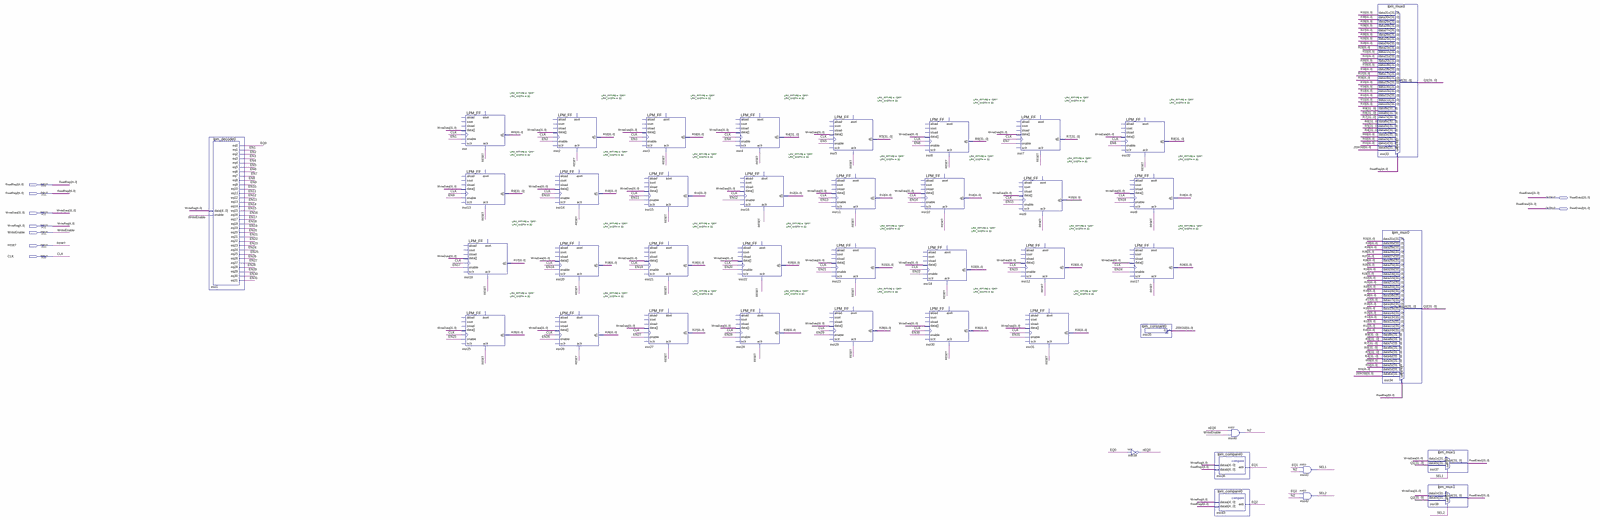
[diagram p0: schematic sheet, whole]
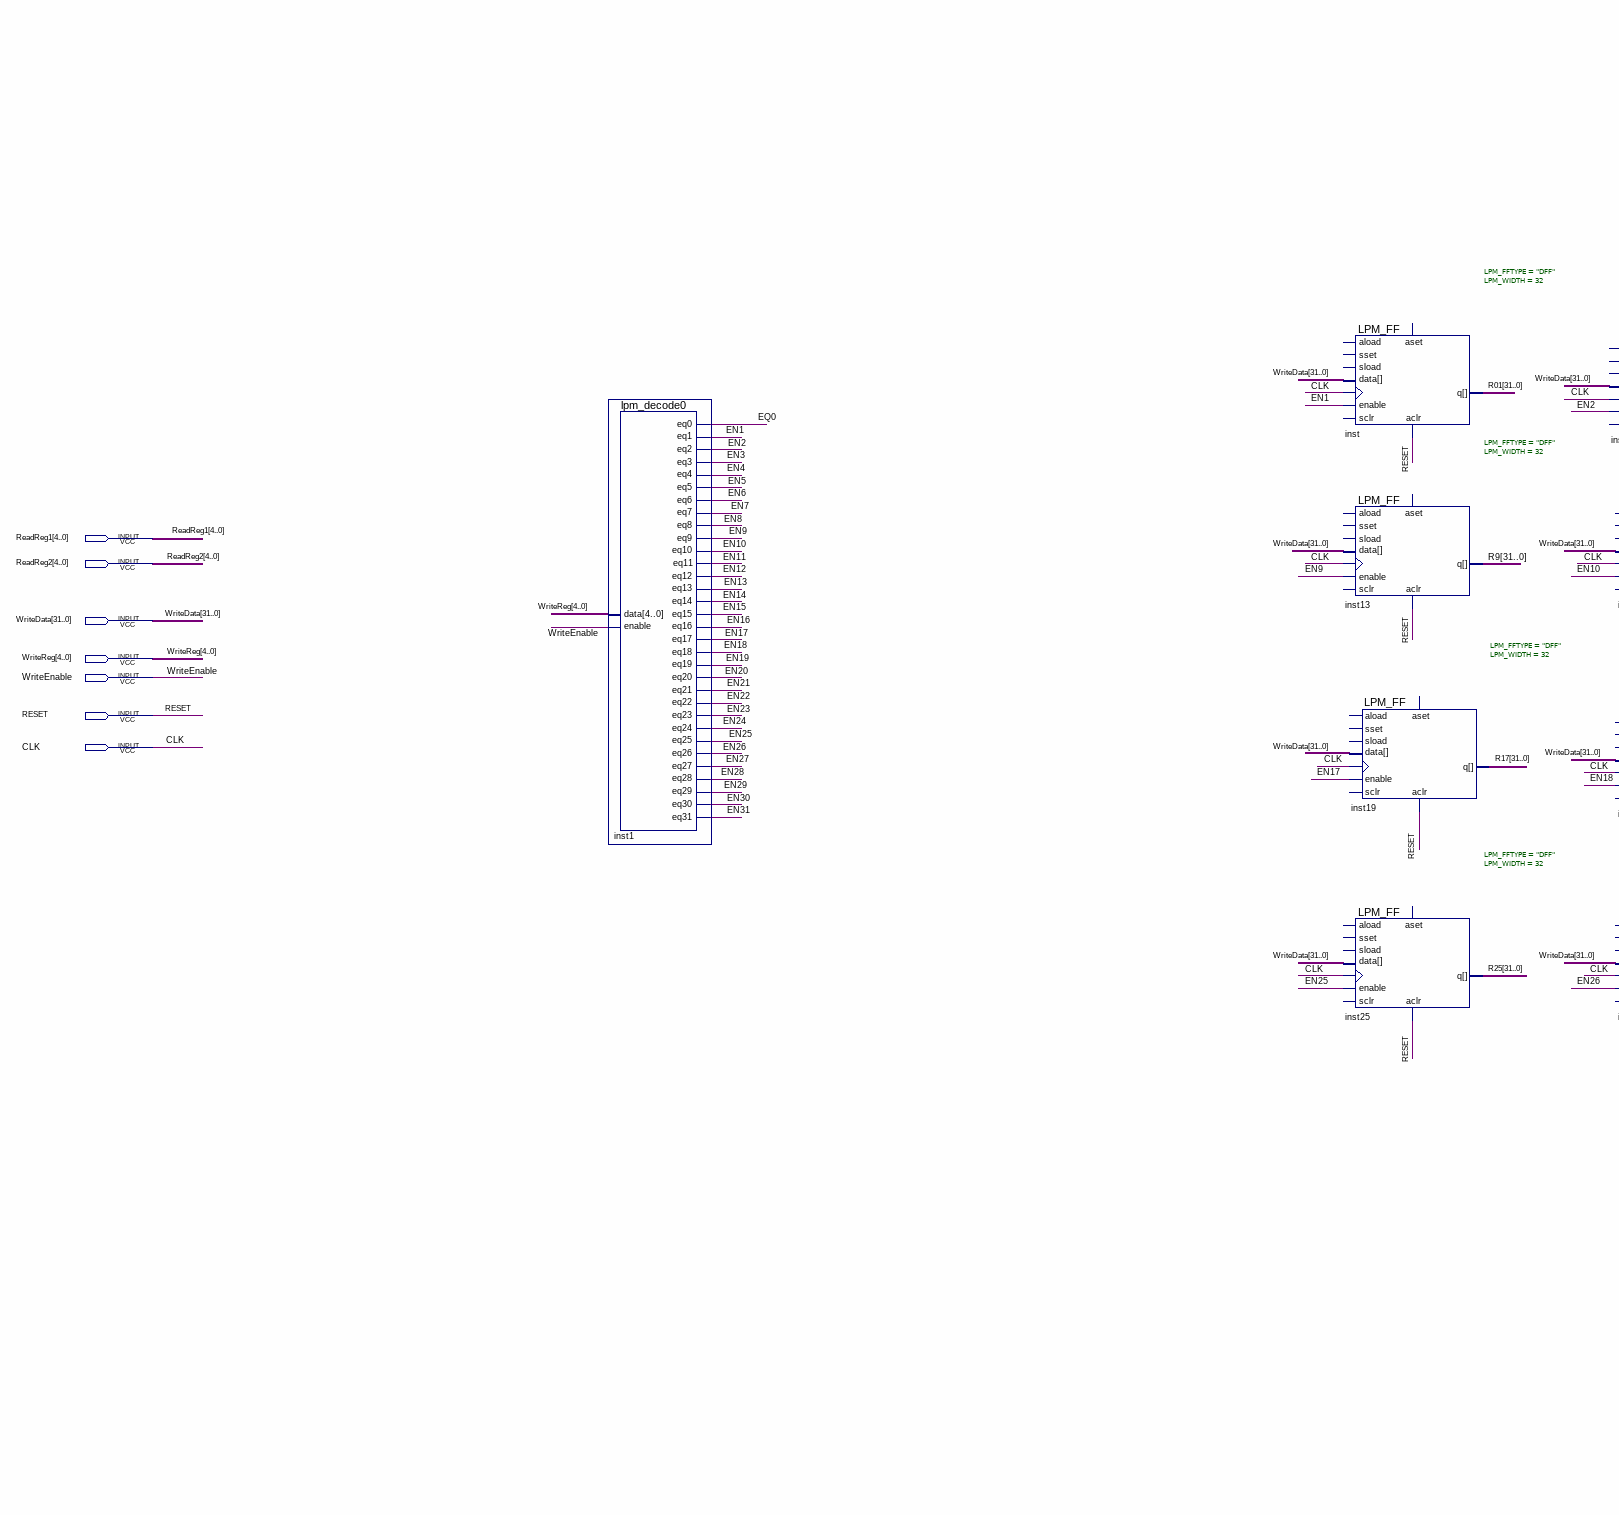
[diagram p1: schematic sheet, left part]
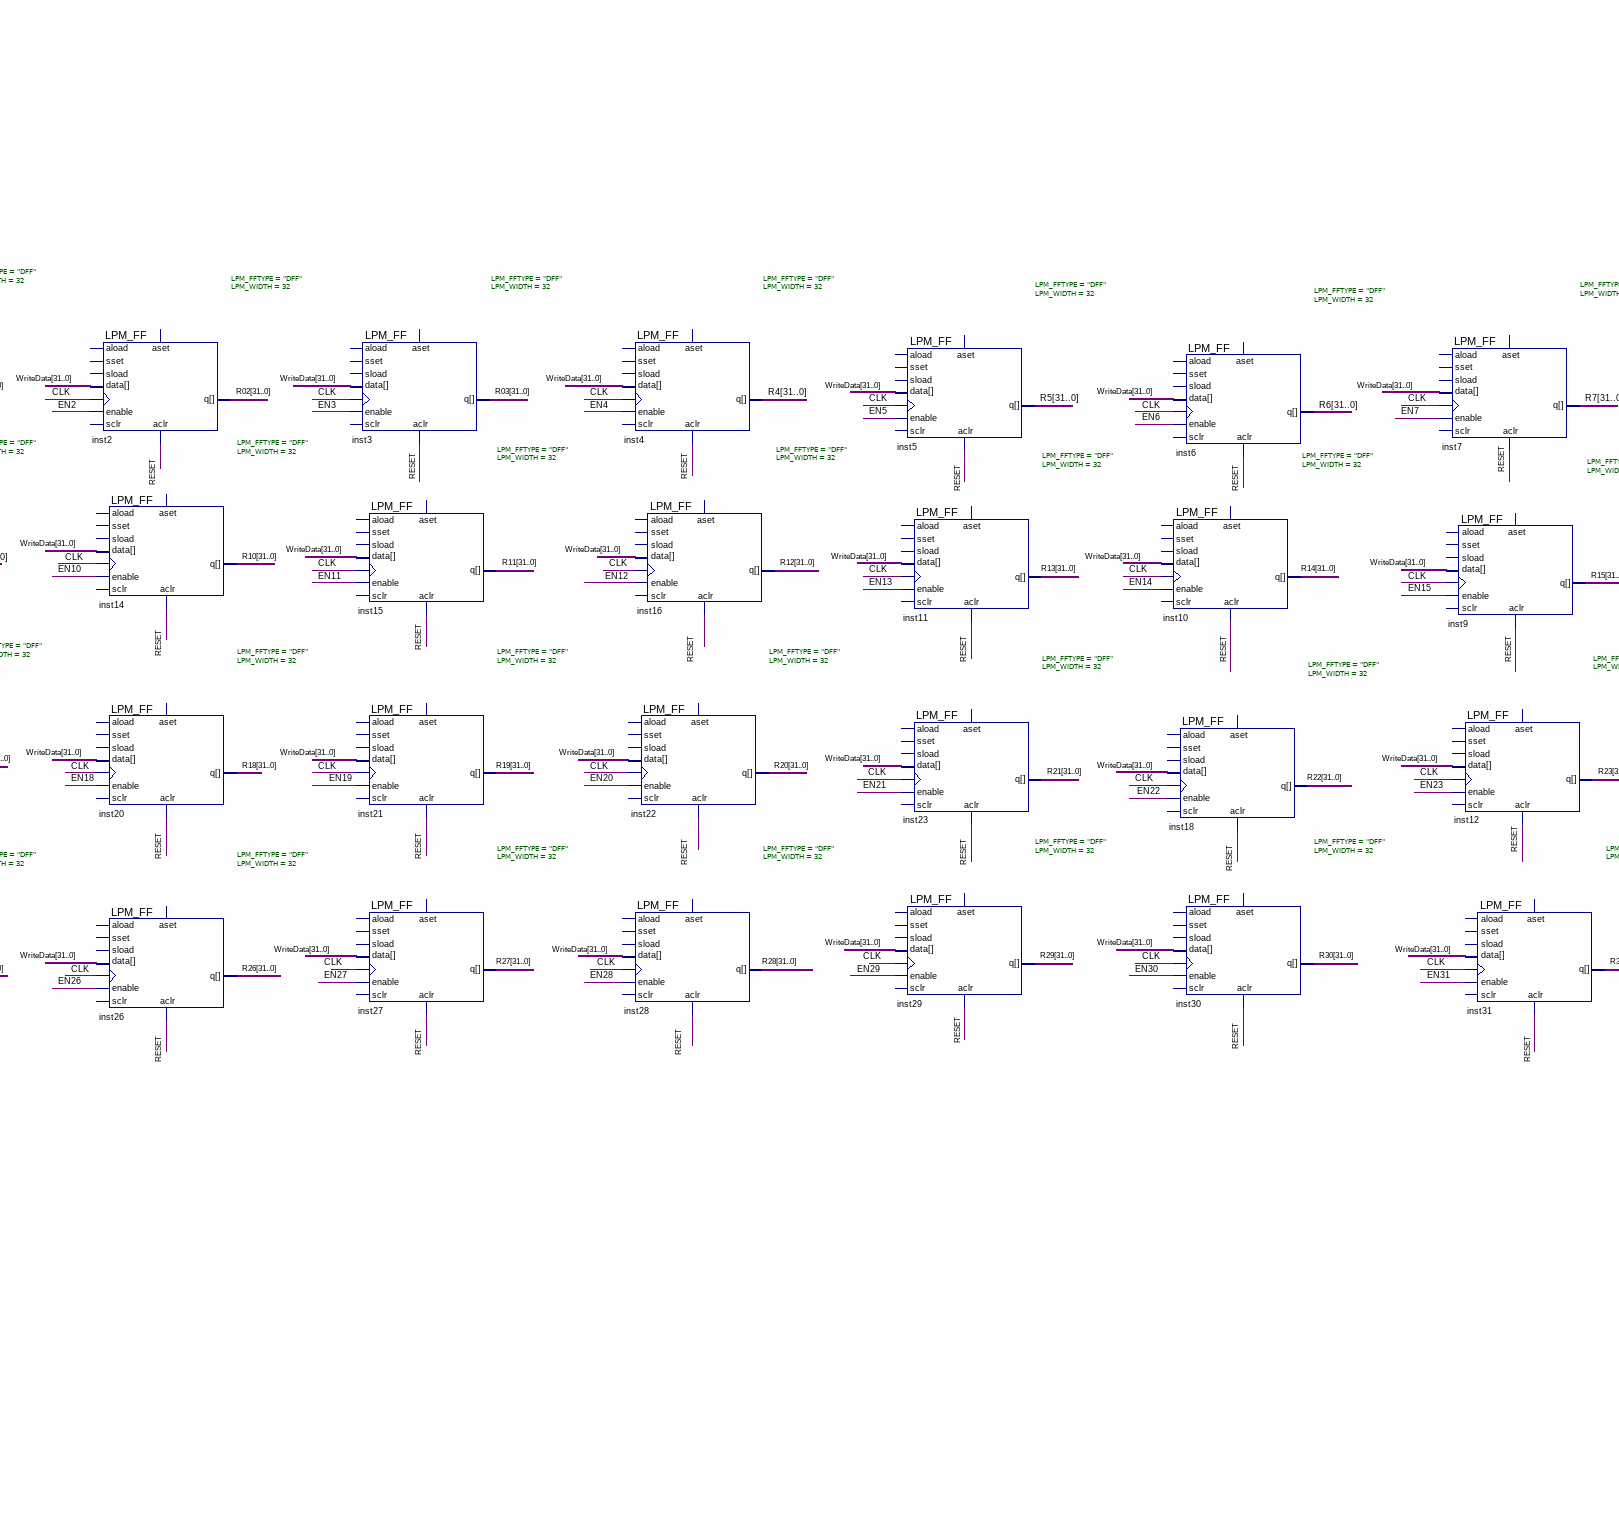
[diagram p2: schematic sheet, centre part]
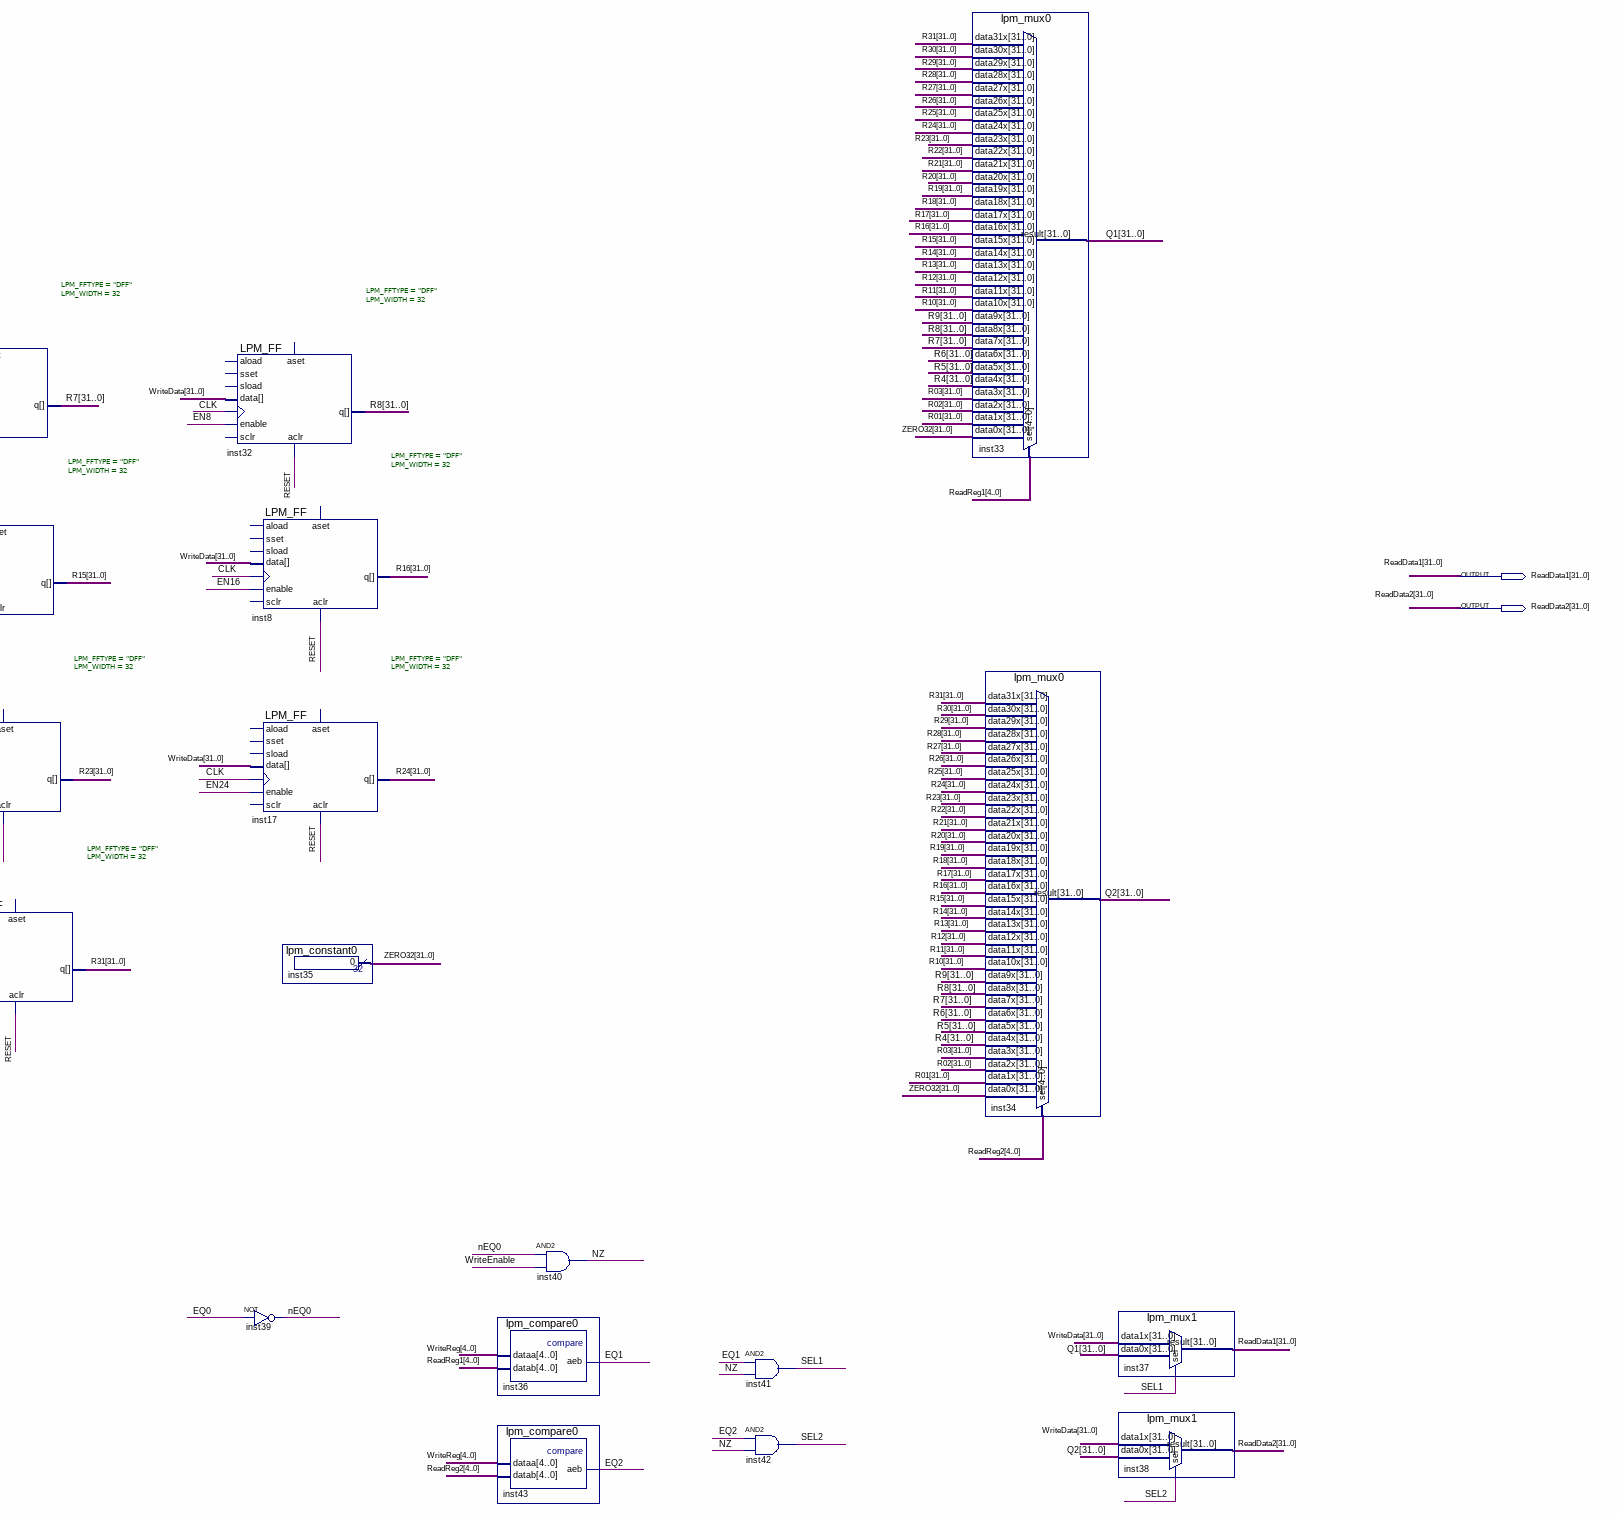
[diagram p3: schematic sheet, right part]
// Quartus schematic RegisterFile.bdf as structural Verilog: 43 symbols, 9 pins
module RegisterFile (
  input  [4:0] ReadReg1,
  input  [4:0] ReadReg2,
  input  [31:0] WriteData,
  input  [4:0] WriteReg,
  input  WriteEnable,
  input  RESET,
  input  CLK,
  output [31:0] ReadData1,
  output [31:0] ReadData2
);

  wire EN1, EN2, EN3, EN4, EN5, EN6, EN7, EN8, EN9, EN10, EN11, EN12, EN13, EN14, EN15, EN16, EN17, EN18,
       EN19, EN20, EN21, EN22, EN23, EN24, EN25, EN26, EN27, EN28, EN29, EN30, EN31, EQ0, EQ1, EQ2, nEQ0, NZ,
       SEL1, SEL2;
  wire [31:0] Q1, Q2, R01, R02, R03, R4, R5, R6, R7, R8, R9, R10, R11, R12, R13, R14, R15, R16, R17, R18,
       R19, R20, R21, R22, R23, R24, R25, R26, R27, R28, R29, R30, R31, ZERO32;

  lpm_decode0 inst1 (
    .data(WriteReg), .enable(WriteEnable), .eq0(EQ0), .eq1(EN1), .eq2(EN2), .eq3(EN3), .eq4(EN4), .eq5(EN5),
    .eq6(EN6), .eq7(EN7), .eq8(EN8), .eq9(EN9), .eq10(EN10), .eq11(EN11), .eq12(EN12), .eq13(EN13),
    .eq14(EN14), .eq15(EN15), .eq16(EN16), .eq17(EN17), .eq18(EN18), .eq19(EN19), .eq20(EN20), .eq21(EN21),
    .eq22(EN22), .eq23(EN23), .eq24(EN24), .eq25(EN25), .eq26(EN26), .eq27(EN27), .eq28(EN28), .eq29(EN29),
    .eq30(EN30), .eq31(EN31));
  LPM_FF #(.LPM_FFTYPE("DFF"), .LPM_WIDTH(32)) inst (
    .enable(EN1), .clock(CLK), .aclr(RESET), .data(WriteData), .q(R01));  // open: aload, sset, sload, aset, sclr
  LPM_FF #(.LPM_FFTYPE("DFF"), .LPM_WIDTH(32)) inst13 (
    .enable(EN9), .clock(CLK), .aclr(RESET), .data(WriteData), .q(R9));  // open: aload, sset, sload, aset, sclr
  LPM_FF #(.LPM_FFTYPE("DFF"), .LPM_WIDTH(32)) inst19 (
    .enable(EN17), .clock(CLK), .aclr(RESET), .data(WriteData), .q(R17));  // open: aload, sset, sload, aset, sclr
  LPM_FF #(.LPM_FFTYPE("DFF"), .LPM_WIDTH(32)) inst25 (
    .enable(EN25), .clock(CLK), .aclr(RESET), .data(WriteData), .q(R25));  // open: aload, sset, sload, aset, sclr
  LPM_FF #(.LPM_FFTYPE("DFF"), .LPM_WIDTH(32)) inst2 (
    .enable(EN2), .clock(CLK), .aclr(RESET), .data(WriteData), .q(R02));  // open: aload, sset, sload, aset, sclr
  LPM_FF #(.LPM_FFTYPE("DFF"), .LPM_WIDTH(32)) inst14 (
    .enable(EN10), .clock(CLK), .aclr(RESET), .data(WriteData), .q(R10));  // open: aload, sset, sload, aset, sclr
  LPM_FF #(.LPM_FFTYPE("DFF"), .LPM_WIDTH(32)) inst20 (
    .enable(EN18), .clock(CLK), .aclr(RESET), .data(WriteData), .q(R18));  // open: aload, sset, sload, aset, sclr
  LPM_FF #(.LPM_FFTYPE("DFF"), .LPM_WIDTH(32)) inst26 (
    .enable(EN26), .clock(CLK), .aclr(RESET), .data(WriteData), .q(R26));  // open: aload, sset, sload, aset, sclr
  LPM_FF #(.LPM_FFTYPE("DFF"), .LPM_WIDTH(32)) inst3 (
    .enable(EN3), .clock(CLK), .aclr(RESET), .data(WriteData), .q(R03));  // open: aload, sset, sload, aset, sclr
  LPM_FF #(.LPM_FFTYPE("DFF"), .LPM_WIDTH(32)) inst15 (
    .enable(EN11), .clock(CLK), .aclr(RESET), .data(WriteData), .q(R11));  // open: aload, sset, sload, aset, sclr
  LPM_FF #(.LPM_FFTYPE("DFF"), .LPM_WIDTH(32)) inst21 (
    .enable(EN19), .clock(CLK), .aclr(RESET), .data(WriteData), .q(R19));  // open: aload, sset, sload, aset, sclr
  LPM_FF #(.LPM_FFTYPE("DFF"), .LPM_WIDTH(32)) inst27 (
    .enable(EN27), .clock(CLK), .aclr(RESET), .data(WriteData), .q(R27));  // open: aload, sset, sload, aset, sclr
  LPM_FF #(.LPM_FFTYPE("DFF"), .LPM_WIDTH(32)) inst4 (
    .enable(EN4), .clock(CLK), .aclr(RESET), .data(WriteData), .q(R4));  // open: aload, sset, sload, aset, sclr
  LPM_FF #(.LPM_FFTYPE("DFF"), .LPM_WIDTH(32)) inst16 (
    .enable(EN12), .clock(CLK), .aclr(RESET), .data(WriteData), .q(R12));  // open: aload, sset, sload, aset, sclr
  LPM_FF #(.LPM_FFTYPE("DFF"), .LPM_WIDTH(32)) inst22 (
    .enable(EN20), .clock(CLK), .aclr(RESET), .data(WriteData), .q(R20));  // open: aload, sset, sload, aset, sclr
  LPM_FF #(.LPM_FFTYPE("DFF"), .LPM_WIDTH(32)) inst28 (
    .enable(EN28), .clock(CLK), .aclr(RESET), .data(WriteData), .q(R28));  // open: aload, sset, sload, aset, sclr
  LPM_FF #(.LPM_FFTYPE("DFF"), .LPM_WIDTH(32)) inst5 (
    .enable(EN5), .clock(CLK), .aclr(RESET), .data(WriteData), .q(R5));  // open: aload, sset, sload, aset, sclr
  LPM_FF #(.LPM_FFTYPE("DFF"), .LPM_WIDTH(32)) inst11 (
    .enable(EN13), .clock(CLK), .aclr(RESET), .data(WriteData), .q(R13));  // open: aload, sset, sload, aset, sclr
  LPM_FF #(.LPM_FFTYPE("DFF"), .LPM_WIDTH(32)) inst23 (
    .enable(EN21), .clock(CLK), .aclr(RESET), .data(WriteData), .q(R21));  // open: aload, sset, sload, aset, sclr
  LPM_FF #(.LPM_FFTYPE("DFF"), .LPM_WIDTH(32)) inst29 (
    .enable(EN29), .clock(CLK), .aclr(RESET), .data(WriteData), .q(R29));  // open: aload, sset, sload, aset, sclr
  LPM_FF #(.LPM_FFTYPE("DFF"), .LPM_WIDTH(32)) inst6 (
    .enable(EN6), .clock(CLK), .aclr(RESET), .data(WriteData), .q(R6));  // open: aload, sset, sload, aset, sclr
  LPM_FF #(.LPM_FFTYPE("DFF"), .LPM_WIDTH(32)) inst10 (
    .enable(EN14), .clock(CLK), .aclr(RESET), .data(WriteData), .q(R14));  // open: aload, sset, sload, aset, sclr
  LPM_FF #(.LPM_FFTYPE("DFF"), .LPM_WIDTH(32)) inst18 (
    .enable(EN22), .clock(CLK), .aclr(RESET), .data(WriteData), .q(R22));  // open: aload, sset, sload, aset, sclr
  LPM_FF #(.LPM_FFTYPE("DFF"), .LPM_WIDTH(32)) inst30 (
    .enable(EN30), .clock(CLK), .aclr(RESET), .data(WriteData), .q(R30));  // open: aload, sset, sload, aset, sclr
  LPM_FF #(.LPM_FFTYPE("DFF"), .LPM_WIDTH(32)) inst7 (
    .enable(EN7), .clock(CLK), .aclr(RESET), .data(WriteData), .q(R7));  // open: aload, sset, sload, aset, sclr
  LPM_FF #(.LPM_FFTYPE("DFF"), .LPM_WIDTH(32)) inst9 (
    .enable(EN15), .clock(CLK), .aclr(RESET), .data(WriteData), .q(R15));  // open: aload, sset, sload, aset, sclr
  LPM_FF #(.LPM_FFTYPE("DFF"), .LPM_WIDTH(32)) inst12 (
    .enable(EN23), .clock(CLK), .aclr(RESET), .data(WriteData), .q(R23));  // open: aload, sset, sload, aset, sclr
  LPM_FF #(.LPM_FFTYPE("DFF"), .LPM_WIDTH(32)) inst31 (
    .enable(EN31), .clock(CLK), .aclr(RESET), .data(WriteData), .q(R31));  // open: aload, sset, sload, aset, sclr
  LPM_FF #(.LPM_FFTYPE("DFF"), .LPM_WIDTH(32)) inst32 (
    .enable(EN8), .clock(CLK), .aclr(RESET), .data(WriteData), .q(R8));  // open: aload, sset, sload, aset, sclr
  LPM_FF #(.LPM_FFTYPE("DFF"), .LPM_WIDTH(32)) inst8 (
    .enable(EN16), .clock(CLK), .aclr(RESET), .data(WriteData), .q(R16));  // open: aload, sset, sload, aset, sclr
  LPM_FF #(.LPM_FFTYPE("DFF"), .LPM_WIDTH(32)) inst17 (
    .enable(EN24), .clock(CLK), .aclr(RESET), .data(WriteData), .q(R24));  // open: aload, sset, sload, aset, sclr
  not inst39 (nEQ0, EQ0);
  lpm_constant0 inst35 (.result(ZERO32));
  lpm_compare0 inst36 (.dataa(WriteReg), .datab(ReadReg1), .aeb(EQ1));
  lpm_compare0 inst43 (.dataa(WriteReg), .datab(ReadReg2), .aeb(EQ2));
  and inst40 (NZ, nEQ0, WriteEnable);
  and inst41 (SEL1, EQ1, NZ);
  and inst42 (SEL2, EQ2, NZ);
  lpm_mux0 inst33 (
    .data31x(R31), .data30x(R30), .data29x(R29), .data28x(R28), .data27x(R27), .data26x(R26), .data25x(R25),
    .data24x(R24), .data23x(R23), .data22x(R22), .data21x(R21), .data20x(R20), .data19x(R19), .data18x(R18),
    .data17x(R17), .data16x(R16), .data15x(R15), .data14x(R14), .data13x(R13), .data12x(R12), .data11x(R11),
    .data10x(R10), .data9x(R9), .data8x(R8), .data7x(R7), .data6x(R6), .data5x(R5), .data4x(R4),
    .data3x(R03), .data2x(R02), .data1x(R01), .data0x(ZERO32), .sel(ReadReg1), .result(Q1));
  lpm_mux0 inst34 (
    .data31x(R31), .data30x(R30), .data29x(R29), .data28x(R28), .data27x(R27), .data26x(R26), .data25x(R25),
    .data24x(R24), .data23x(R23), .data22x(R22), .data21x(R21), .data20x(R20), .data19x(R19), .data18x(R18),
    .data17x(R17), .data16x(R16), .data15x(R15), .data14x(R14), .data13x(R13), .data12x(R12), .data11x(R11),
    .data10x(R10), .data9x(R9), .data8x(R8), .data7x(R7), .data6x(R6), .data5x(R5), .data4x(R4),
    .data3x(R03), .data2x(R02), .data1x(R01), .data0x(ZERO32), .sel(ReadReg2), .result(Q2));
  lpm_mux1 inst37 (.data1x(WriteData), .data0x(Q1), .sel(SEL1), .result(ReadData1));
  lpm_mux1 inst38 (.data1x(WriteData), .data0x(Q2), .sel(SEL2), .result(ReadData2));
endmodule
